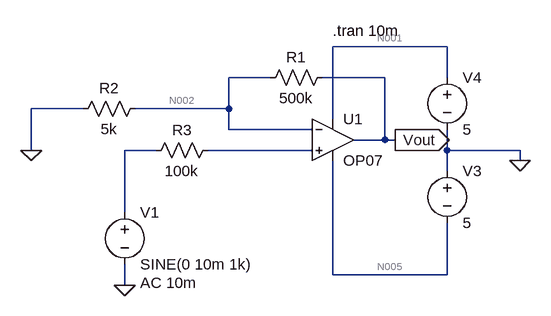
[diagram p0: schematic CL2_T11_NonInvertingAmplifier.asc]
CL2_T11_NonInvertingAmplifier.asc, the LTspice schematic file:
Version 4.1
SHEET 1 880 680
WIRE 400 32 224 32
WIRE 128 80 64 80
WIRE 304 80 208 80
WIRE 400 80 400 32
WIRE -160 128 -240 128
WIRE 64 128 64 80
WIRE 64 128 -80 128
WIRE 224 144 224 32
WIRE 64 160 64 128
WIRE 192 160 64 160
WIRE 304 176 304 80
WIRE 304 176 256 176
WIRE 320 176 304 176
WIRE -240 192 -240 128
WIRE -48 192 -96 192
WIRE 192 192 32 192
WIRE 400 192 400 160
WIRE 512 192 400 192
WIRE 512 208 512 192
WIRE 400 224 400 192
WIRE -96 288 -96 192
WIRE 224 384 224 208
WIRE 400 384 400 304
WIRE 400 384 224 384
WIRE -96 400 -96 368
FLAG 512 208 0
FLAG 320 176 Vout
IOPIN 320 176 Out
FLAG -96 400 0
FLAG -240 192 0
SYMBOL OpAmps\\OP07 224 112 R0
SYMATTR InstName U1
SYMBOL voltage 400 64 R0
SYMATTR InstName V4
SYMATTR Value 5
SYMBOL voltage 400 208 R0
SYMATTR InstName V3
SYMATTR Value 5
SYMBOL res 224 64 R90
WINDOW 0 0 56 VBottom 2
WINDOW 3 32 56 VTop 2
SYMATTR InstName R1
SYMATTR Value 500k
SYMBOL voltage -96 272 R0
WINDOW 123 24 124 Left 2
WINDOW 39 0 0 Left 0
SYMATTR InstName V1
SYMATTR Value SINE(0 10m 1k)
SYMATTR Value2 AC 10m
SYMBOL res -64 112 R90
WINDOW 0 0 56 VBottom 2
WINDOW 3 32 56 VTop 2
SYMATTR InstName R2
SYMATTR Value 5k
SYMBOL res 48 176 R90
WINDOW 0 0 56 VBottom 2
WINDOW 3 32 56 VTop 2
SYMATTR InstName R3
SYMATTR Value 100k
TEXT 224 8 Left 2 !.tran 10m

The netlist it stands for:
* CL2_T11_NonInvertingAmplifier.asc
X§U1 N004 N002 N001 N005 Vout LT1001  ; OP07, pins In+ In- V+ V- OUT
V4 N001 0 5
V3 0 N005 5
R1 Vout N002 500k
V1 N003 0 SINE(0 10m 1k) AC 10m
R2 N002 0 5k
R3 N004 N003 100k
.tran 10m
.lib LTC.lib
.backanno
.end

* Results of the author's LTspice run, read from the files saved beside the schematic
* Operating Point, zero values left out:
*   V(n001) = 5 V
*   V(n005) = -5 V
*   I(V3) = -2.25 mA
*   I(V4) = -2.25 mA
*   Ix(u1:3) = 2.25 mA
*   Ix(u1:4) = -2.25 mA
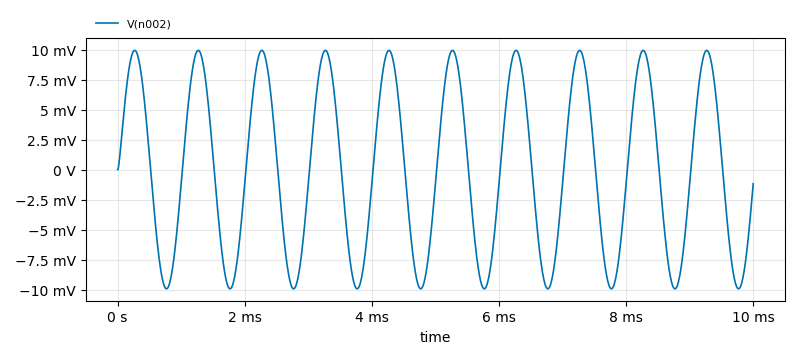
[diagram p1: Transient Analysis of CL2_T11_NonInvertingAmplifier.asc, plotted from the saved traces]
* Transient Analysis, 1 run:
*   V(n002): min -9.931 mV, max 9.931 mV, average 2.192 µV, rms 7.022 mV, last -1.177 mV